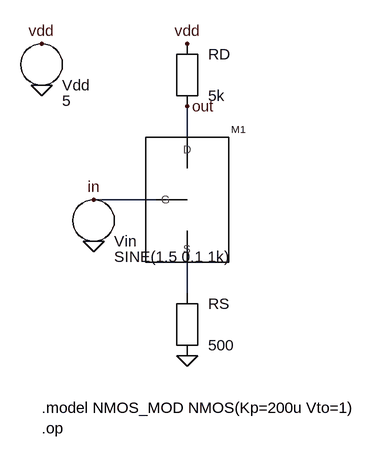
[diagram p0: schematic common_source_drawn.asc]
common_source_drawn.asc, the LTspice schematic file:
Version 4
SHEET 1 880 680
WIRE 320 176 320 224
WIRE 320 416 320 464
WIRE 176 320 272 320
FLAG 96 80 vdd
FLAG 320 80 vdd
FLAG 176 320 in
FLAG 320 176 out
FLAG 96 144 0
FLAG 176 384 0
FLAG 320 560 0
SYMBOL nmos 320 320 R0
SYMATTR InstName M1
SYMATTR Value NMOS_MOD
SYMBOL res 320 128 R0
SYMATTR InstName RD
SYMATTR Value 5k
SYMBOL res 320 512 R0
SYMATTR InstName RS
SYMATTR Value 500
SYMBOL voltage 176 352 R0
SYMATTR InstName Vin
SYMATTR Value SINE(1.5 0.1 1k)
SYMBOL voltage 96 112 R0
SYMATTR InstName Vdd
SYMATTR Value 5
TEXT 96 640 Left 2 !.model NMOS_MOD NMOS(Kp=200u Vto=1)
TEXT 96 672 Left 2 !.op

The netlist it stands for:
* common_source_drawn.asc
M1 out in N001 N001 NMOS_MOD
RD vdd out 5k
RS N001 0 500
Vin in 0 SINE(1.5 0.1 1k)
Vdd vdd 0 5
.model NMOS NMOS
.model PMOS PMOS
.lib standard.mos
.model NMOS_MOD NMOS(Kp=200u Vto=1)
.op
.backanno
.end